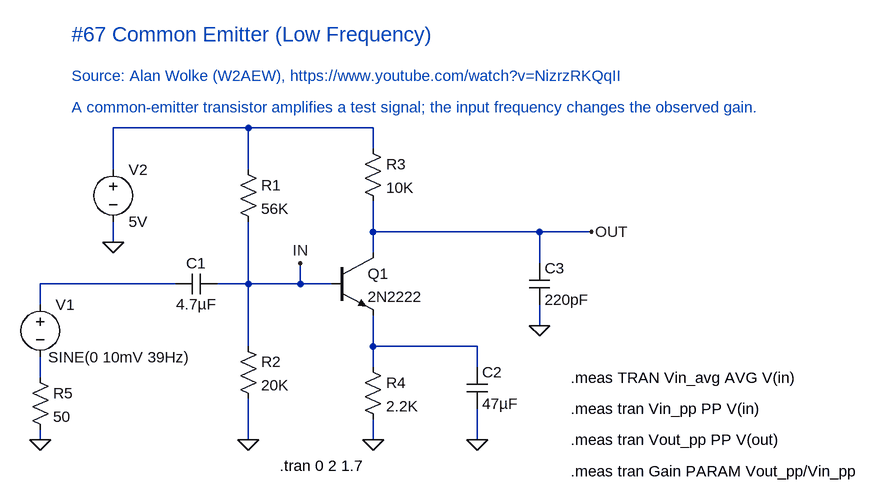
[diagram p0: schematic Common Emitter (Low Frequency).asc]
Common Emitter (Low Frequency).asc, the LTspice schematic file:
Version 4.1
SHEET 1 1400 680
WIRE 128 -160 -80 -160
WIRE 320 -160 128 -160
WIRE 320 -128 320 -160
WIRE -80 -96 -80 -160
WIRE 128 -96 128 -160
WIRE 320 0 320 -48
WIRE 576 0 320 0
WIRE 656 0 576 0
WIRE -80 16 -80 -16
WIRE 320 32 320 0
WIRE 576 48 576 0
WIRE 16 80 -192 80
WIRE 128 80 128 -16
WIRE 128 80 80 80
WIRE 208 80 208 48
WIRE 208 80 128 80
WIRE 256 80 208 80
WIRE -192 112 -192 80
WIRE 576 144 576 112
WIRE 128 176 128 80
WIRE 320 176 320 128
WIRE 480 176 320 176
WIRE 320 208 320 176
WIRE 480 208 480 176
WIRE -192 224 -192 192
WIRE -192 320 -192 304
WIRE 128 320 128 256
WIRE 320 320 320 288
WIRE 480 320 480 272
FLAG 128 320 0
FLAG 320 320 0
FLAG 480 320 0
FLAG 576 144 0
FLAG -80 16 0
FLAG 656 0 OUT
FLAG -192 320 0
FLAG 208 48 IN
SYMBOL cap 80 64 R90
WINDOW 0 0 32 VBottom 2
WINDOW 3 32 32 VTop 2
SYMATTR InstName C1
SYMATTR Value 4.7µF
SYMBOL res 112 -112 R0
SYMATTR InstName R1
SYMATTR Value 56K
SYMBOL res 112 160 R0
SYMATTR InstName R2
SYMATTR Value 20K
SYMBOL npn 256 32 R0
SYMATTR InstName Q1
SYMATTR Value 2N2222
SYMBOL res 304 -144 R0
SYMATTR InstName R3
SYMATTR Value 10K
SYMBOL res 304 192 R0
SYMATTR InstName R4
SYMATTR Value 2.2K
SYMBOL cap 464 208 R0
SYMATTR InstName C2
SYMATTR Value 47µF
SYMBOL cap 560 48 R0
SYMATTR InstName C3
SYMATTR Value 220pF
SYMBOL voltage -80 -112 R0
WINDOW 123 0 0 Left 0
WINDOW 39 0 0 Left 0
SYMATTR InstName V2
SYMATTR Value 5V
SYMBOL voltage -192 96 R0
WINDOW 3 12 97 Left 2
WINDOW 123 0 0 Left 0
WINDOW 39 0 0 Left 0
SYMATTR Value SINE(0 10mV 39Hz)
SYMATTR InstName V1
SYMBOL res -208 208 R0
SYMATTR InstName R5
SYMATTR Value 50
TEXT 176 360 Left 2 !.tran 0 2 1.7
TEXT 624 224 Left 2 !.meas TRAN Vin_avg AVG V(in)
TEXT 624 272 Left 2 !.meas tran Vin_pp PP V(in)
TEXT 624 320 Left 2 !.meas tran Vout_pp PP V(out)
TEXT 624 368 Left 2 !.meas tran Gain PARAM Vout_pp/Vin_pp
TEXT -144 -304 Left 3 ;#67 Common Emitter (Low Frequency)
TEXT -144 -240 Left 2 ;Source: Alan Wolke (W2AEW), https://www.youtube.com/watch?v=NizrzRKQqII
TEXT -144 -192 Left 2 ;A common-emitter transistor amplifies a test signal; the input frequency changes the observed gain.

The netlist it stands for:
* Common Emitter (Low Frequency).asc
C1 IN N002 4.7µF
R1 N001 IN 56K
R2 IN 0 20K
Q1 OUT IN N003 0 2N2222
R3 N001 OUT 10K
R4 N003 0 2.2K
C2 N003 0 47µF
C3 OUT 0 220pF
V2 N001 0 5V
V1 N002 N004 SINE(0 10mV 39Hz)
R5 N004 0 50
.model NPN NPN
.model PNP PNP
.lib standard.bjt
.tran 0 2 1.7
.meas TRAN Vin_avg AVG V(in)
.meas tran Vin_pp PP V(in)
.meas tran Vout_pp PP V(out)
.meas tran Gain PARAM Vout_pp/Vin_pp
* #67 Common Emitter (Low Frequency)
* Source: Alan Wolke (W2AEW), https://www.youtube.com/watch?v=NizrzRKQqII
* A common-emitter transistor amplifies a test signal; the input frequency changes the observed gain.
.backanno
.end